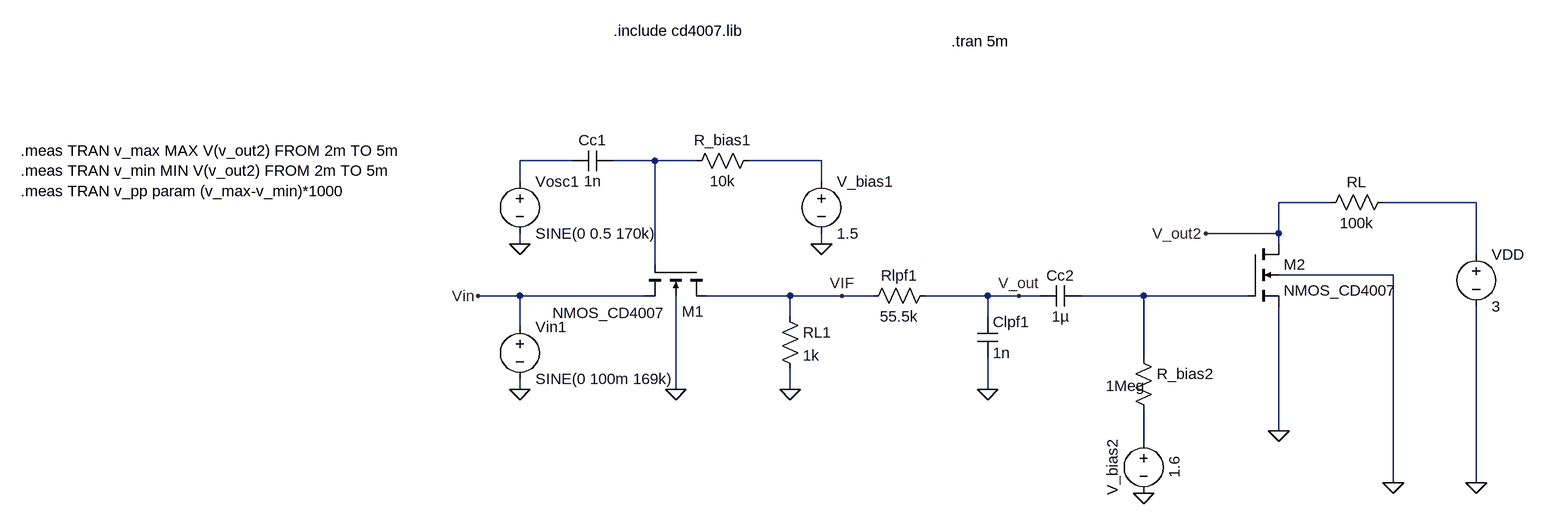
[diagram p0: schematic Lab_Amplifier.asc]
Lab_Amplifier.asc, the LTspice schematic file:
Version 4.1
SHEET 1 1960 680
WIRE -64 -64 -144 -64
WIRE 64 -64 0 -64
WIRE 128 -64 64 -64
WIRE 320 -64 208 -64
WIRE -144 -32 -144 -64
WIRE 320 -32 320 -64
WIRE 1104 0 1024 0
WIRE 1328 0 1184 0
WIRE 1024 48 1024 0
WIRE 1024 48 912 48
WIRE -144 64 -144 48
WIRE 320 64 320 48
WIRE 1024 64 1024 48
WIRE 1328 80 1328 0
WIRE 64 96 64 -64
WIRE 1200 112 1024 112
WIRE -144 144 -208 144
WIRE 48 144 -144 144
WIRE 272 144 144 144
WIRE 352 144 272 144
WIRE 400 144 352 144
WIRE 576 144 480 144
WIRE 624 144 576 144
WIRE 656 144 624 144
WIRE 816 144 720 144
WIRE 976 144 816 144
WIRE 272 176 272 144
WIRE 576 176 576 144
WIRE -144 192 -144 144
WIRE 816 240 816 144
WIRE -144 288 -144 272
WIRE 96 288 96 144
WIRE 272 288 272 256
WIRE 576 288 576 240
WIRE 1024 352 1024 160
WIRE 816 368 816 320
WIRE 1200 432 1200 112
WIRE 1328 432 1328 160
FLAG -144 288 0
FLAG 96 288 0
FLAG 272 288 0
FLAG 320 64 0
FLAG -144 64 0
FLAG 352 144 VIF
FLAG -208 144 Vin
FLAG 576 288 0
FLAG 624 144 V_out
FLAG 912 48 V_out2
FLAG 1024 352 0
FLAG 816 448 0
FLAG 1328 432 0
FLAG 1200 432 0
SYMBOL nmos4 144 96 R90
WINDOW 0 72 5 VRight 2
WINDOW 3 74 64 VRight 2
SYMATTR InstName M1
SYMATTR Value NMOS_CD4007
SYMATTR Value2 l=5u w=170u
SYMBOL res 256 160 R0
SYMATTR InstName RL1
SYMATTR Value 1k
SYMBOL voltage -144 176 R0
WINDOW 123 0 0 Left 0
WINDOW 39 0 0 Left 0
SYMATTR InstName Vin1
SYMATTR Value SINE(0 100m 169k)
SYMBOL res 224 -80 R90
WINDOW 0 0 56 VBottom 2
WINDOW 3 32 56 VTop 2
SYMATTR InstName R_bias1
SYMATTR Value 10k
SYMBOL voltage 320 -48 R0
SYMATTR InstName V_bias1
SYMATTR Value 1.5
SYMBOL cap 0 -80 R90
WINDOW 0 0 32 VBottom 2
WINDOW 3 32 32 VTop 2
SYMATTR InstName Cc1
SYMATTR Value 1n
SYMBOL voltage -144 -48 R0
WINDOW 123 0 0 Left 0
WINDOW 39 0 0 Left 0
SYMATTR InstName Vosc1
SYMATTR Value SINE(0 0.5 170k)
SYMBOL res 496 128 R90
WINDOW 0 0 56 VBottom 2
WINDOW 3 32 56 VTop 2
SYMATTR InstName Rlpf1
SYMATTR Value 55.5k
SYMBOL cap 560 176 R0
SYMATTR InstName Clpf1
SYMATTR Value 1n
SYMBOL nmos4 976 64 R0
SYMATTR InstName M2
SYMATTR Value NMOS_CD4007
SYMATTR Value2 l=5u w=170u
SYMBOL res 1200 -16 R90
WINDOW 0 0 56 VBottom 2
WINDOW 3 32 56 VTop 2
SYMATTR InstName RL
SYMATTR Value 100k
SYMBOL voltage 1328 64 R0
WINDOW 123 0 0 Left 0
WINDOW 39 0 0 Left 0
SYMATTR InstName VDD
SYMATTR Value 3
SYMBOL cap 720 128 R90
WINDOW 0 0 32 VBottom 2
WINDOW 3 32 32 VTop 2
SYMATTR InstName Cc2
SYMATTR Value 1µ
SYMBOL res 800 224 R0
WINDOW 3 -42 59 Left 2
SYMATTR Value 1Meg
SYMATTR InstName R_bias2
SYMBOL voltage 816 352 R0
WINDOW 0 -32 56 VBottom 2
WINDOW 3 32 56 VTop 2
WINDOW 123 0 0 Left 0
WINDOW 39 0 0 Left 0
SYMATTR InstName V_bias2
SYMATTR Value 1.6
TEXT 520 -248 Left 2 !.tran 5m
TEXT 0 -264 Left 2 !.include cd4007.lib
TEXT -912 -80 Left 2 !.meas TRAN v_max MAX V(v_out2) FROM 2m TO 5m\n.meas TRAN v_min MIN V(v_out2) FROM 2m TO 5m\n.meas TRAN v_pp param (v_max-v_min)*1000

The netlist it stands for:
* Lab_Amplifier.asc
M1 VIF N002 Vin 0 NMOS_CD4007 l=5u w=170u
RL1 VIF 0 1k
Vin1 Vin 0 SINE(0 100m 169k)
R_bias1 N003 N002 10k
V_bias1 N003 0 1.5
Cc1 N002 N001 1n
Vosc1 N001 0 SINE(0 0.5 170k)
Rlpf1 V_out VIF 55.5k
Clpf1 V_out 0 1n
M2 V_out2 N005 0 0 NMOS_CD4007 l=5u w=170u
RL N004 V_out2 100k
VDD N004 0 3
Cc2 N005 V_out 1µ
R_bias2 N005 N006 1Meg
V_bias2 N006 0 1.6
.model NMOS NMOS
.model PMOS PMOS
.lib standard.mos
.tran 5m
.include cd4007.lib
.meas TRAN v_max MAX V(v_out2) FROM 2m TO 5m
.meas TRAN v_min MIN V(v_out2) FROM 2m TO 5m
.meas TRAN v_pp param (v_max-v_min)*1000
.backanno
.end